# Altium schematic sheet Top-Sheet.SchDoc
size A4; SheetNumber: 1; SheetTotal: 6
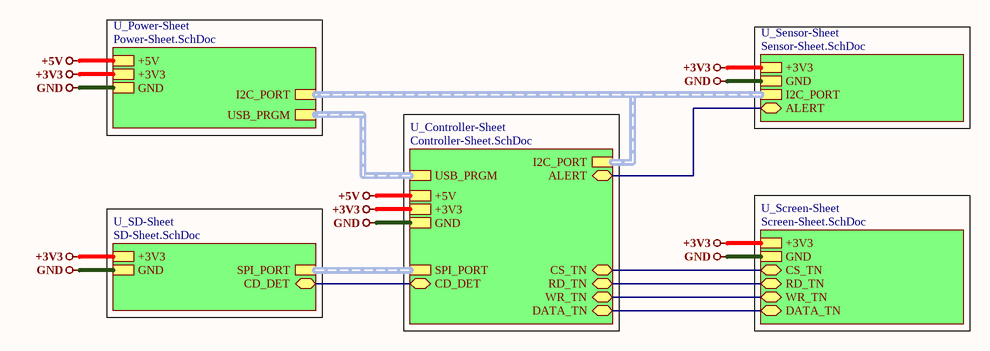
[diagram p0: Top-Sheet.SchDoc]

## Sub-sheets
U_Controller-Sheet = Controller-Sheet.SchDoc: CD_DET (bidir), I2C_PORT (harness I2C_PORT), SPI_PORT (harness SPI_PORT), ALERT (bidir), +3V3, GND, USB_PRGM (harness USB_PRGM), CS_TN (bidir), RD_TN (bidir), WR_TN (bidir), DATA_TN (bidir), +5V
U_Power-Sheet = Power-Sheet.SchDoc: +3V3, GND, USB_PRGM (harness USB_PRGM), +5V, I2C_PORT (harness I2C_PORT)
U_Screen-Sheet = Screen-Sheet.SchDoc: +3V3, GND, CS_TN (bidir), RD_TN (bidir), WR_TN (bidir), DATA_TN (bidir)
U_SD-Sheet = SD-Sheet.SchDoc: +3V3, GND, SPI_PORT (harness SPI_PORT), CD_DET (bidir)
U_Sensor-Sheet = Sensor-Sheet.SchDoc: +3V3, GND, ALERT (bidir), I2C_PORT (harness I2C_PORT)

## Nets
+3V3: sheet U_Controller-Sheet/+3V3, sheet U_Power-Sheet/+3V3, sheet U_Screen-Sheet/+3V3, sheet U_SD-Sheet/+3V3, sheet U_Sensor-Sheet/+3V3
+5V: sheet U_Controller-Sheet/+5V, sheet U_Power-Sheet/+5V
GND: sheet U_Controller-Sheet/GND, sheet U_Power-Sheet/GND, sheet U_Screen-Sheet/GND, sheet U_SD-Sheet/GND, sheet U_Sensor-Sheet/GND
(unnamed): sheet U_Controller-Sheet/CD_DET, sheet U_SD-Sheet/CD_DET
(unnamed): sheet U_Controller-Sheet/ALERT, sheet U_Sensor-Sheet/ALERT
(unnamed): sheet U_Controller-Sheet/CS_TN, sheet U_Screen-Sheet/CS_TN
(unnamed): sheet U_Controller-Sheet/RD_TN, sheet U_Screen-Sheet/RD_TN
(unnamed): sheet U_Controller-Sheet/WR_TN, sheet U_Screen-Sheet/WR_TN
(unnamed): sheet U_Controller-Sheet/DATA_TN, sheet U_Screen-Sheet/DATA_TN

## Buses and harness runs
harness sheet U_Controller-Sheet/I2C_PORT = sheet U_Power-Sheet/I2C_PORT = sheet U_Sensor-Sheet/I2C_PORT
harness sheet U_Controller-Sheet/SPI_PORT = sheet U_SD-Sheet/SPI_PORT
harness sheet U_Controller-Sheet/USB_PRGM = sheet U_Power-Sheet/USB_PRGM

## Notes on the sheet
- File:
- Title:
- Date:
- Page
- Num:
- Total:
- Drawn By: Huzaifa Ali